# Altium project charge_monitor.PrjPcb
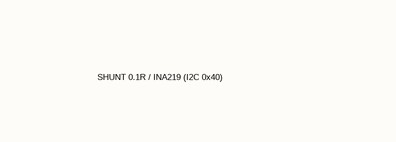
[diagram p0: charge_monitor.SchDoc, top left]
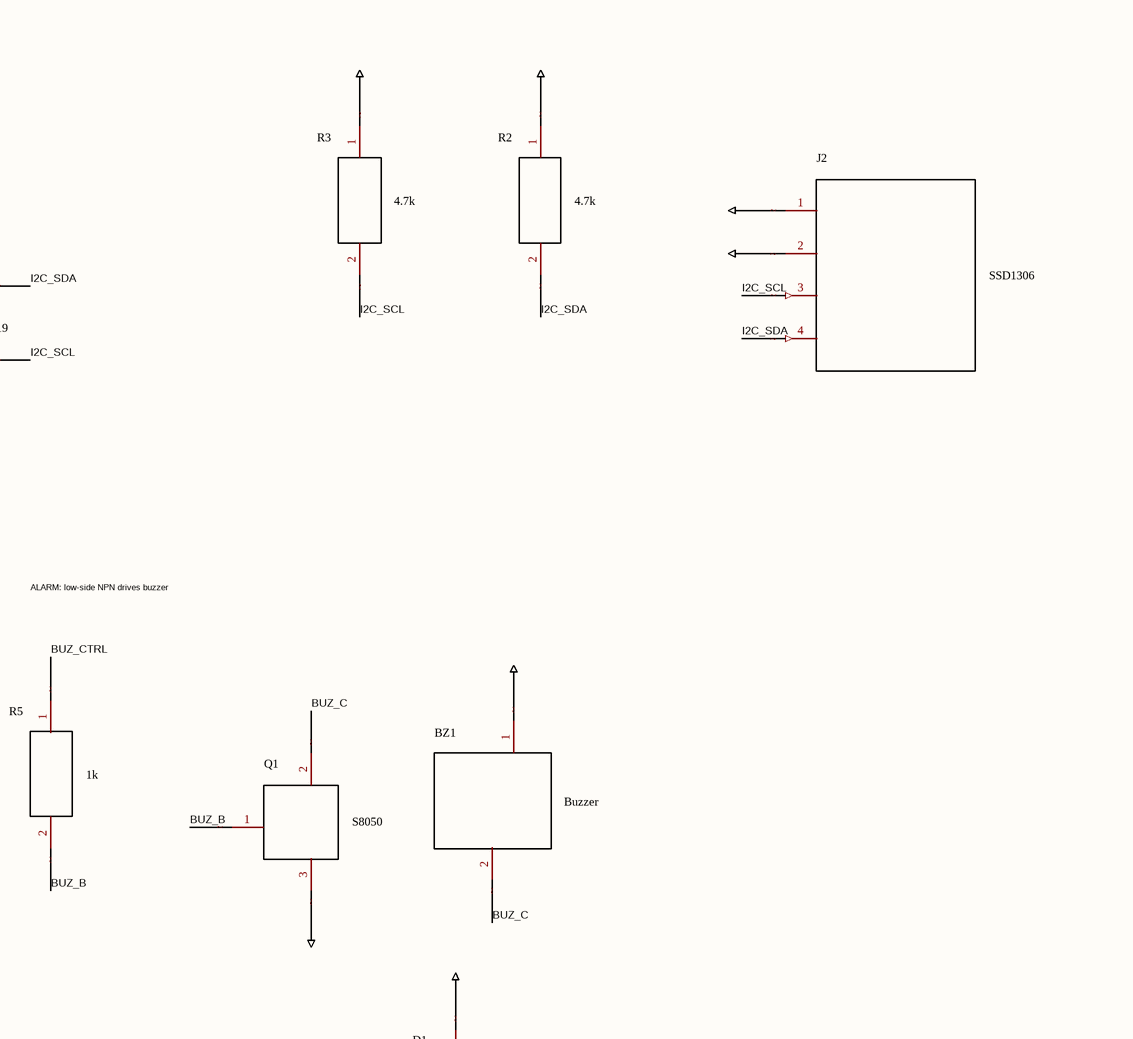
[diagram p1: charge_monitor.SchDoc, top right]
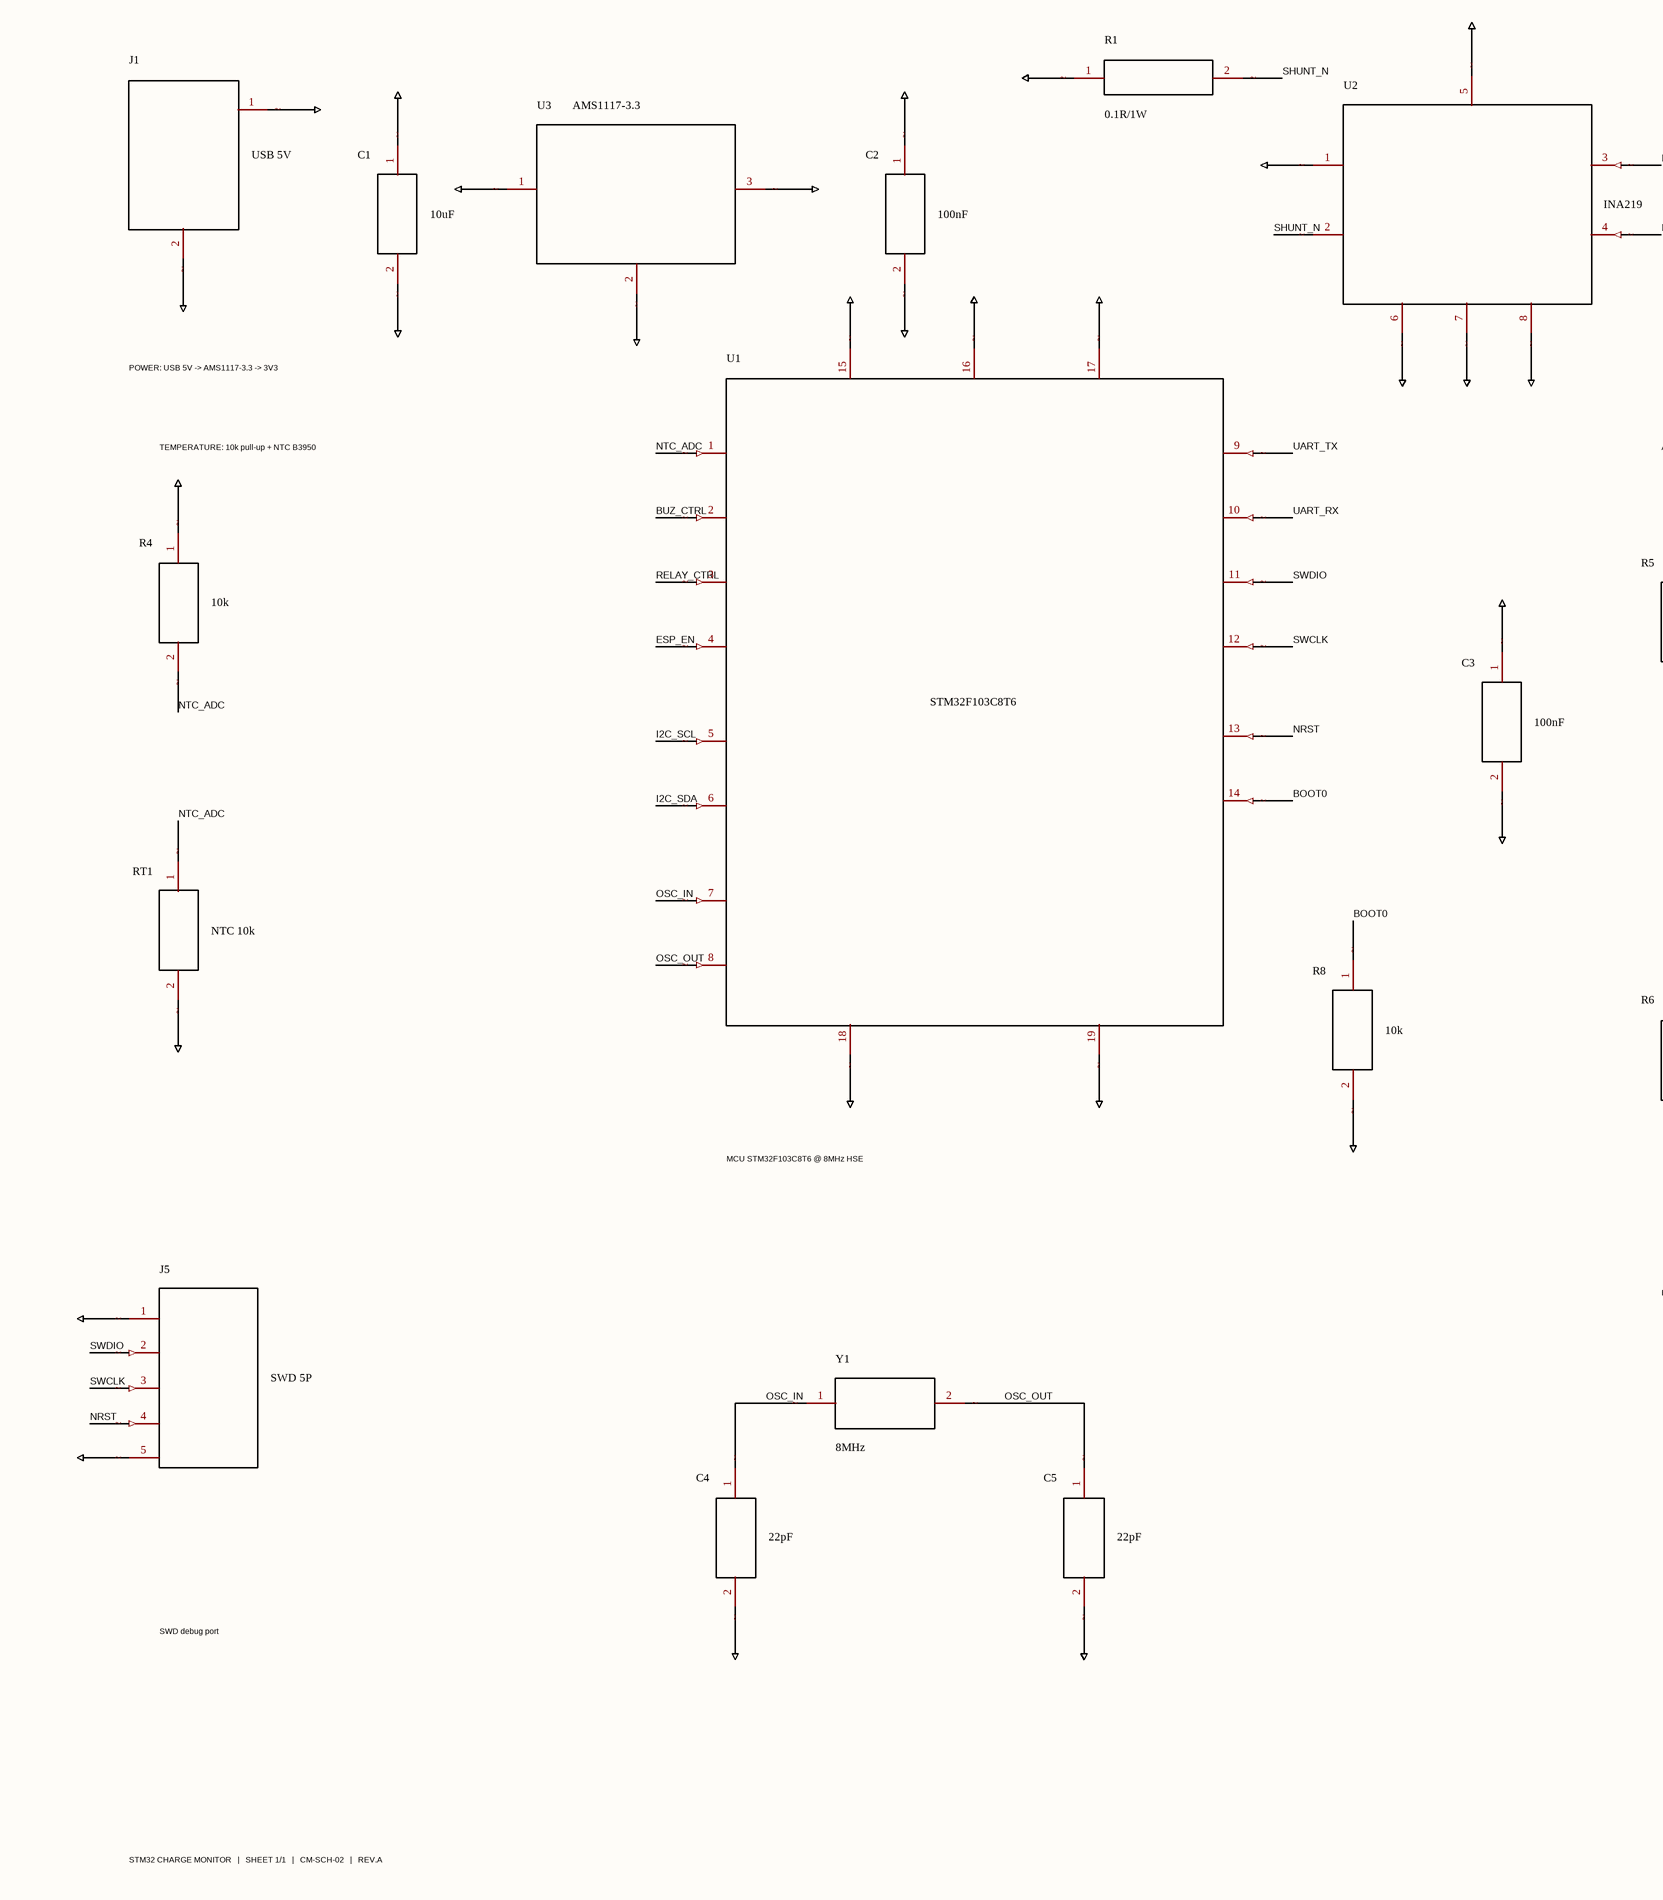
[diagram p2: charge_monitor.SchDoc, bottom left]
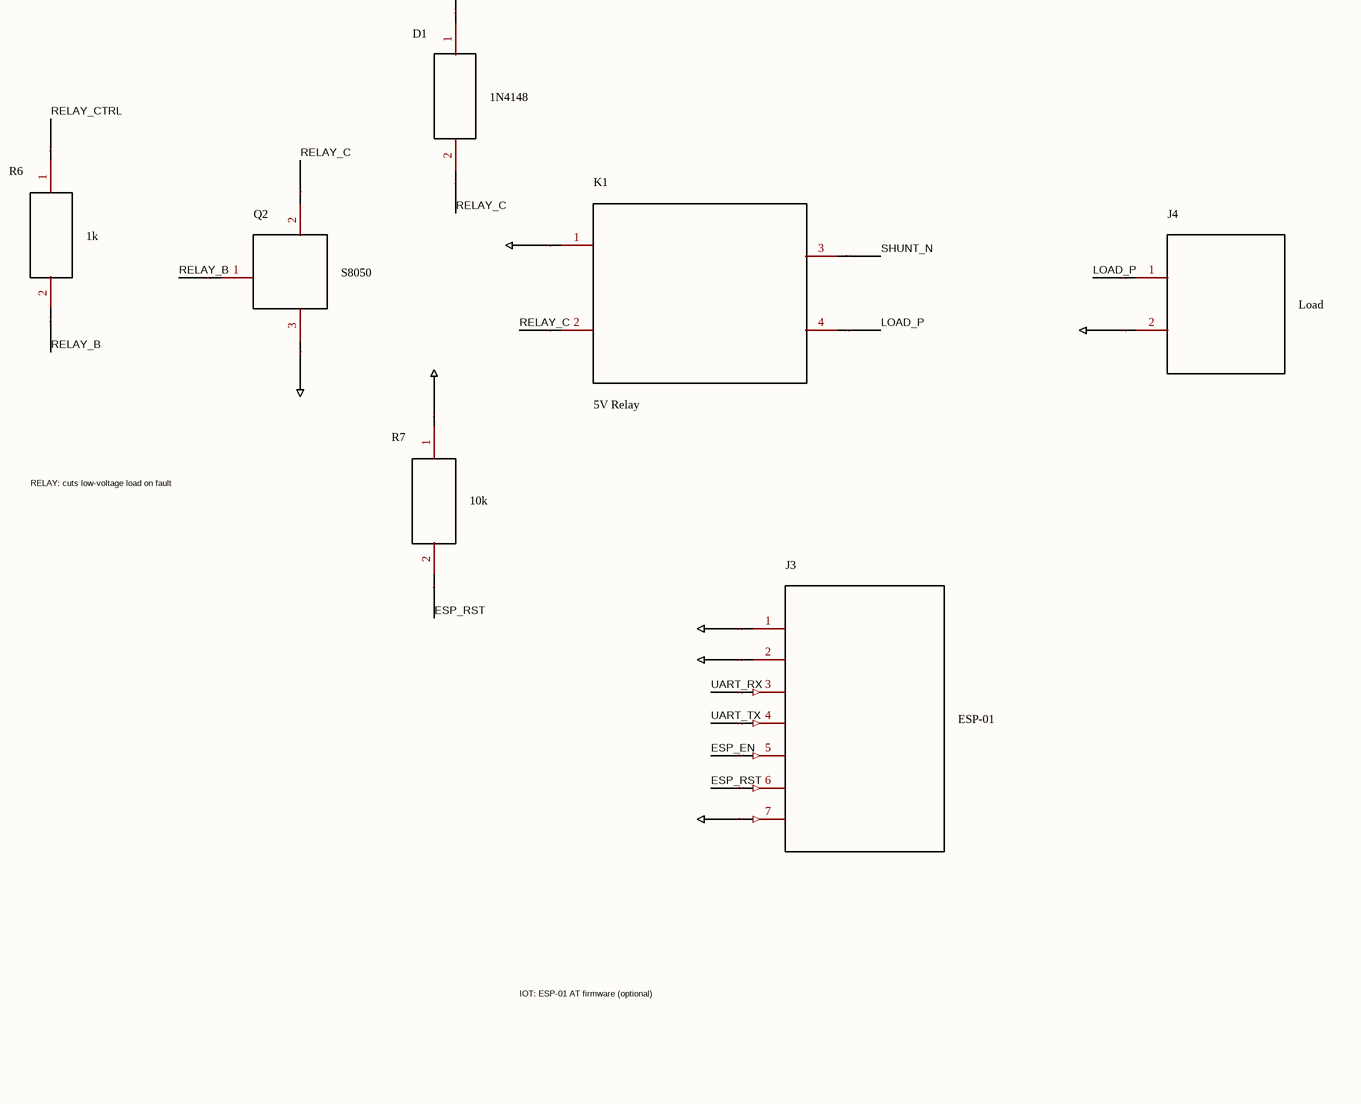
[diagram p3: charge_monitor.SchDoc, bottom right]
1 sheet, 28 parts. Net scope: global (net labels, ports and power ports of the same name join across sheets).

## Sheet charge_monitor.SchDoc
size 594 x 420 mm

### Parts
BZ1  Buzzer
C1  10uF
C2  100nF
C3  100nF
C4  22pF
C5  22pF
D1  1N4148
J1  USB 5V
J2  SSD1306
J3  ESP-01
J4  Load
J5  SWD 5P
K1  5V Relay
Q1  S8050
Q2  S8050
R1  0.1R/1W
R2  4.7k
R3  4.7k
R4  10k
R5  1k
R6  1k
R7  10k
R8  10k
RT1  NTC 10k
U1  STM32F103C8T6
U2  INA219
U3  AMS1117-3.3
Y1  8MHz

### Nets

Not connected (* = marked no-connect by the designer): BZ1 1(~) 2(~); C1 1(~) 2(~); C2 1(~) 2(~); C3 1(~) 2(~); C4 1(~) 2(~); C5 1(~) 2(~); D1 1(~) 2(~); J1 1(~) 2(~); J2 1(~) 2(~) 3(~) 4(~); J3 1(~) 2(~) 3(~) 4(~) 5(~) 6(~) 7(~); J4 1(~) 2(~); J5 1(~) 2(~) 3(~) 4(~) 5(~); K1 1(~) 2(~) 3(~) 4(~); Q1 1(~) 2(~) 3(~); Q2 1(~) 2(~) 3(~); R1 1(~) 2(~); R2 1(~) 2(~); R3 1(~) 2(~); R4 1(~) 2(~); R5 1(~) 2(~); R6 1(~) 2(~); R7 1(~) 2(~); R8 1(~) 2(~); RT1 1(~) 2(~); U1 1(~) 2(~) 3(~) 4(~) 5(~) 6(~) 7(~) 8(~) 9(~) 10(~) 11(~) 12(~) 13(~) 14(~) 15(~) 16(~) 17(~) 18(~) 19(~); U2 1(~) 2(~) 3(~) 4(~) 5(~) 6(~) 7(~) 8(~); U3 1(~) 2(~) 3(~); Y1 1(~) 2(~)

### Notes on the sheet
- SHUNT 0.1R / INA219 (I2C 0x40)
- POWER: USB 5V -> AMS1117-3.3 -> 3V3
- TEMPERATURE: 10k pull-up + NTC B3950
- ALARM: low-side NPN drives buzzer
- MCU STM32F103C8T6 @ 8MHz HSE
- RELAY: cuts low-voltage load on fault
- SWD debug port
- IOT: ESP-01 AT firmware (optional)
- STM32 CHARGE MONITOR   |   SHEET 1/1   |   CM-SCH-02   |   REV.A

### Library data of the parts
C1-C5 = CAP
D1 = D_1N4148
J1 = USB_5V
J2 = OLED
J5 = SWD
K1 = RELAY
R1 = R_SHUNT
R2-R8 = R
RT1 = NTC
Y1 = XTAL